# Altium schematic sheet BATTERY PACK-Sheet.SchDoc
size A; SheetNumber: 2; SheetTotal: 4
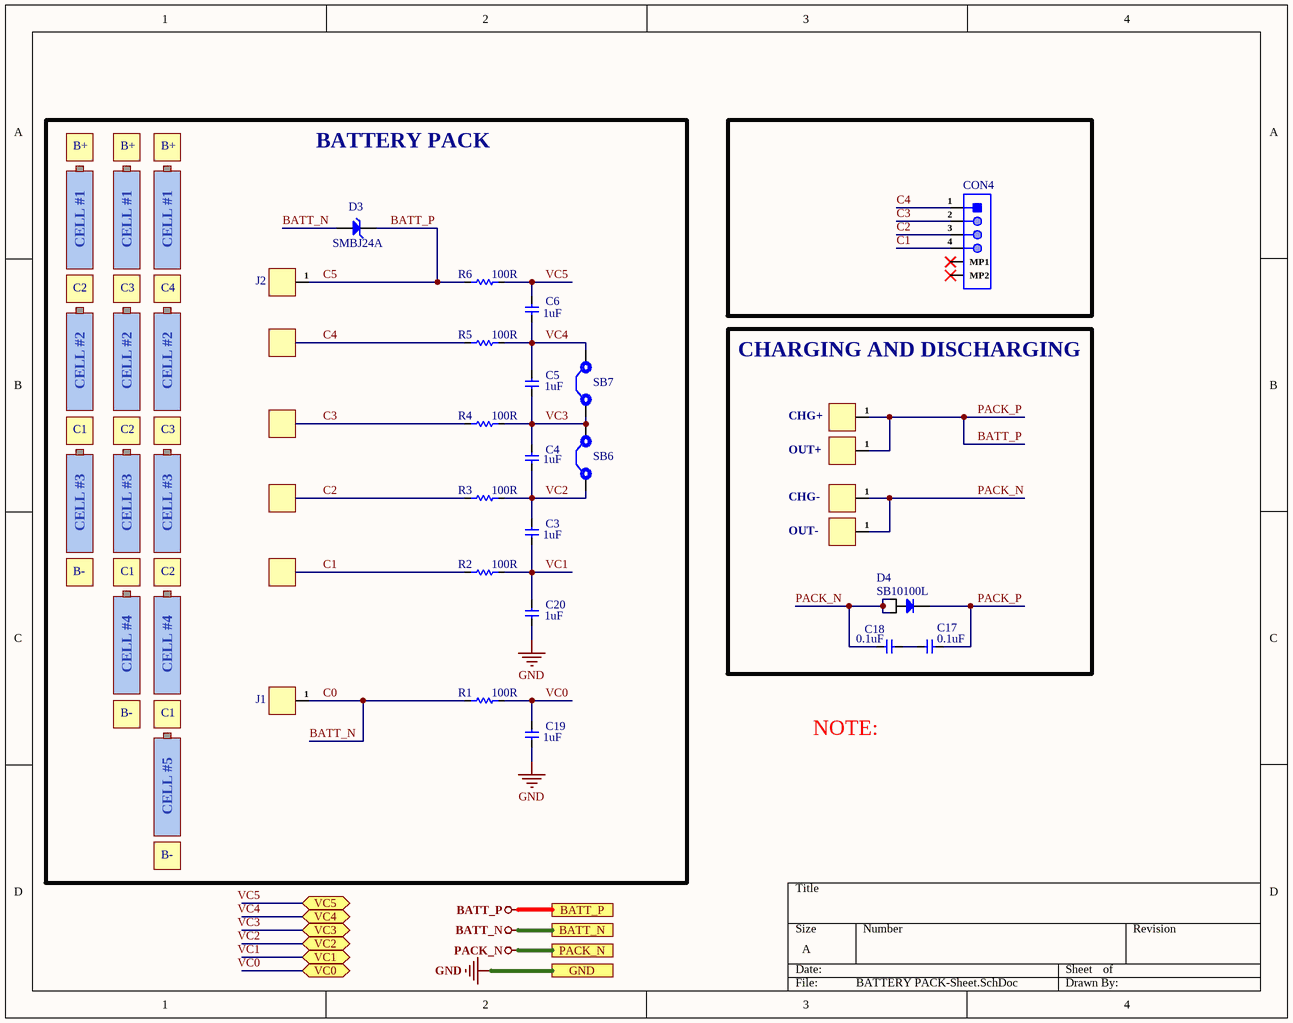
[diagram p0: BATTERY PACK-Sheet.SchDoc]

## Parts
C3  1uF  [Cap-0402]
C4  1uF  [Cap-0402]
C5  1uF  [Cap-0402]
C6  1uF  [Cap-0402]
C17  0.1uF  [CAP-0603]
C18  0.1uF  [CAP-0603]
C19  1uF  [Cap-0402]
C20  1uF  [Cap-0402]
CON4  S4B-ZR-SM4A-TF(LF)(SN)  [S4B-ZR-SM4A-TF(LF)(SN)]  (value not drawn)
D3  SMBJ24A  [SMB_]
D4  SB10100L  [SB10100L]
J1  Through_Hole_Pad  [Through Hole Pad (High Power)_]  (value not drawn)
J2  Through_Hole_Pad  [Through Hole Pad (High Power)_]  (value not drawn)
J7  Through_Hole_Pad  [Through Hole Pad (High Power)_]  (value not drawn)
J8  Through_Hole_Pad  [Through Hole Pad (High Power)_]  (value not drawn)
J9  Through_Hole_Pad  [Through Hole Pad (High Power)_]  (value not drawn)
J10  Through_Hole_Pad  [Through Hole Pad (High Power)_]  (value not drawn)
R1  100R  [RES-0805]
R2  100R  [RES-0805]
R3  100R  [RES-0805]
R4  100R  [RES-0805]
R5  100R  [RES-0805]
R6  100R  [RES-0805]
SB6  Solder Bridge 0402  [Solder Bridge 0402]  (value not drawn)
SB7  Solder Bridge 0402  [Solder Bridge 0402]  (value not drawn)

## Blocks framed on the sheet
BATTERY PACK: C3-C6 C19 C20 D3 J1 J2 R1-R6 SB6 SB7
CHARGING AND DISCHARGING: C17 C18 D4 J7-J10

## Ports
BATT_N (see Top-Sheet[2C], BMS-Sheet[2D]), BATT_P (see Top-Sheet[2C], BMS-Sheet[2D]), GND (see Top-Sheet[2B], BMS-Controller-Sheet[2D], BMS-Sheet[2D]), PACK_N (see Top-Sheet[2C], BMS-Sheet[2D]), VC0 (bidir, see Top-Sheet[2C], BMS-Sheet[2D]), VC1 (bidir, see Top-Sheet[2C], BMS-Sheet[2D]), VC2 (bidir, see Top-Sheet[2C], BMS-Sheet[2D]), VC3 (bidir, see Top-Sheet[2C], BMS-Sheet[2D]), VC4 (bidir, see Top-Sheet[2B], BMS-Sheet[2D]), VC5 (bidir, see Top-Sheet[2B], BMS-Sheet[2D])

## Nets
BATT_N: D3.1(A) J1.1 R1.1 ; port BATT_N  [also labelled C0]
BATT_P: C17.2 D3.2(K) D4.3(K) J2.1 J7.1 J8.1 R6.1 ; port BATT_P  [also labelled C5, PACK_P]
GND: C19.1 C20.1 ; port GND
PACK_N: C18.1 D4.1(A) D4.2(A) J9.1 J10.1 ; port PACK_N
C1: CON4.4 R2.1
C2: CON4.3 R3.1
C3: CON4.2 R4.1
C4: CON4.1 R5.1
VC0: C19.2 R1.2 ; port VC0
VC1: C3.1 C20.2 R2.2 ; port VC1
VC2: C3.2 C4.1 R3.2 SB6.1 ; port VC2
VC3: C4.2 C5.1 R4.2 SB6.2 SB7.1 ; port VC3
VC4: C5.2 C6.1 R5.2 SB7.2 ; port VC4
VC5: C6.2 R6.2 ; port VC5
NetC17_1: C17.1 C18.2

Not connected (* = marked no-connect by the designer): CON4 MP1* MP2*

## Notes on the sheet
- B+
- CELL #1
- C2
- C3
- C4
- CELL #2
- C1
- CHG+
- CELL #3
- OUT+
- CHG-
- OUT-
- B-
- CELL #4
- NOTE:
- CELL #5

## Library data of the parts
C3-C6 C19 C20 = GRM155R61E105KA12D: CAP CER 1UF 25V X5R 0402; Manufacturer: Murata; Material: Ceramic; Tolerance: 10%; Supplier 1: Digi-Key; Manufacturer Part Number: GRM155R61E105KA12D; Stock 1: 1150750; Pricing 1: 1=0.11, 10=0.077, 100=0.0363, 500=0.02546, 1000=0.02108, 2500=0.01962, 5000=0.01795 (USD); Mount: Surface Mount; Case/Package: 0402; Case Code (Metric): 1005; Case Code (Imperial): 0402; Min Operating Temperature: -55°C; Max Operating Temperature: 85°C; Package Quantity: 10000; Packaging: Tape and Reel; Capacitance: 1uF; Voltage Rating: 25V; Dielectric: X5R; Voltage: 25V; Length: 1mm; Height: 0.5mm; Width: 0.5mm; Thickness: 0.022inch; Depth: 0.5mm; Lead Free: Lead Free; ComponentLink1URL: http://www.farnell.com/datasheets/2048341.pdf?src-supplier=Element14; ComponentLink1Description: http://www.farnell.com/datasheets/2048341.pdf?src-supplier=Element14; Supplier Part Number 1: 490-10017-6-ND; Weight: 0.000212oz; Termination: SMD/SMT; Voltage Rating (DC): 25V; REACH SVHC: No SVHC; LCSC Part Number: C77009
C17 C18 = CL10B104KB8NNNL: CAP CER 0.1UF 50V X7R 0603; Manufacturer: Samsung; Capacitance: 100nF; Tolerance: 10%; Item Type: Capacitor; Supplier 1: Digi-Key; Manufacturer Part Number: CL10B104KB8NNNL; Stock 1: 3731229; Pricing 1: 1=0.1, 10=0.03, 50=0.0164, 100=0.0134, 500=0.00958, 1000=0.00753, 2500=0.00684, 5000=0.0063 (USD); Mount: Surface Mount; Case/Package: 0603; Min Operating Temperature: -55°C; Max Operating Temperature: 125°C; Dielectric: X7R; Packaging: Tape and Reel; Package Quantity: 15000; Voltage Rating: 50V; Voltage Rating (DC): 50V; Series: CL; Construction: Flat; Length: 1.6mm; Width: 0.031inch; Height: 0.8mm; Thickness: 0.035inch; Depth: 0.8mm; Radiation Hardening: No; RoHS Compliant: Yes; ComponentLink1URL: https://www.verical.com/server-webapp/html/getDatasheet?partID=357523&src-supplier=Verical; ComponentLink1Description: https://www.verical.com/server-webapp/html/getDatasheet?partID=357523&src-supplier=Verical; ComponentLink2URL: https://media.digikey.com/pdf/Data%20Sheets/Samsung%20PDFs/CL_Series_MLCC_ds.pdf?src-supplier=Digi-Key; ComponentLink2Description: https://media.digikey.com/pdf/Data%20Sheets/Samsung%20PDFs/CL_Series_MLCC_ds.pdf?src-supplier=Digi-Key; Supplier Part Number 1: 1276-CL10B104KB8NNNLCT-ND; LCSC Part Number: C913912
CON4 = S4B-ZR-SM4A-TF(LF)(SN): CONN HEADER SMD R/A 4POS 1.5MM; Manufacturer: JST; Item Type: Wire To Board Connector; Supplier: Arrow Electronics; Supplier Part Number: S4B-ZR-SM4A-TF(LF)(SN); Manufacturer Part Number: S4B-ZR-SM4A-TF(LF)(SN); RoHS: Yes; Category: Headers and Wire Housings; Stock: 115000; Pricing: 1000=0.3597, 2000=0.3278, 5000=0.3171, 10000=0.2956, 25000=0.2849, 50000=0.2848 (USD); ComponentLink1URL: https://datasheet.ciiva.com/25618/0900766b81147f94-25618478.pdf?src-supplier=Rs; ComponentLink1Description: https://datasheet.ciiva.com/25618/0900766b81147f94-25618478.pdf?src-supplier=Rs; ComponentLink2URL: https://datasheet.ciiva.com/26894/getdatasheetpartid-646289-26894627.pdf?src-supplier=Verical; ComponentLink2Description: https://datasheet.ciiva.com/26894/getdatasheetpartid-646289-26894627.pdf?src-supplier=Verical; ComponentLink3URL: https://datasheet.ciiva.com/26894/getdatasheetpartid-558977-26894928.pdf?src-supplier=Verical; ComponentLink3Description: https://datasheet.ciiva.com/26894/getdatasheetpartid-558977-26894928.pdf?src-supplier=Verical; ComponentLink4URL: https://datasheet.ciiva.com/6832/ezh-6832478.pdf?src-supplier=Digi-Key; ComponentLink4Description: https://datasheet.ciiva.com/6832/ezh-6832478.pdf?src-supplier=Digi-Key; LCSC Part Number: C485354
D3 = SMBJ24A: SMB(DO-214AA); Manufacturer: SMC; Item Type: TVS Diode; Manufacturer Part Number: SMBJ24A; Package: SMB(DO-214AA); LCSC Part Number: C493201
D4 = SB10100L: TO-277 Schottky Barrier Diodes (SBD) ROHS; Manufacturer: TWGMC; Item type: Diode; Manufacturer Part Number: SB10100L; Package: TO-277; ComponentLink1Description: LCSC; ComponentLink1URL: https://www.lcsc.com/product-detail/Schottky-Barrier-Diodes-SBD_TWGMC-SB10100L_C5240369.html; LCSC Part Number: C5240369
J1 J2 J7-J10 = Through_Hole_Pad: Wire Connecting Pad
R1-R6 = AC0805FR-07100RL: RES SMD 100 OHM 1% 1/8W 0805; Manufacturer: Yageo; Item Type: Resistor; Supplier: Future Electronics; Supplier Part Number: 6087312; Manufacturer Part Number: AC0805FR-07100RL; RoHS: Yes; Category: Chip SMD Resistors; Stock: 70000; Pricing: 5000=0.0032, 25000=0.003, 125000=0.0028, 375000=0.0027, 1000000=0.0025 (USD); ComponentLink1URL: https://datasheet.ciiva.com/12656/pyu-ac-51-rohs-l-2-12656967.pdf?src-supplier=Mouser; ComponentLink1Description: https://datasheet.ciiva.com/12656/pyu-ac-51-rohs-l-2-12656967.pdf?src-supplier=Mouser; LCSC Part Number: C138274
SB6 SB7 = Solder Bridge 0402: Solder Bridge ON; Manufacturer Part Number: Solder Bridge 0402; Item Type: Solder Bridge